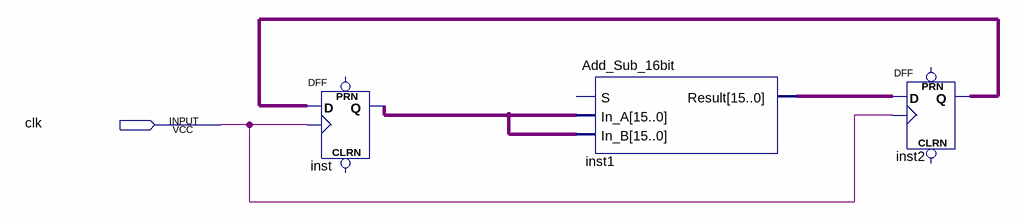
[diagram p0: schematic sheet]
// Quartus schematic test_delay_alu.bdf as structural Verilog: 3 symbols, 1 pins
module test_delay_alu (
  input  clk
);

  wire [15:0] inst1_result, inst2_q, inst_q;

  DFF inst[15:0] (.CLK(clk), .D(inst2_q), .Q(inst_q));  // open: CLRN, PRN
  Add_Sub_16bit inst1 (.In_A(inst_q), .In_B(inst_q), .Result(inst1_result));  // open: S
  DFF inst2[15:0] (.CLK(clk), .D(inst1_result), .Q(inst2_q));  // open: CLRN, PRN
endmodule
